# Altium schematic sheet FORMULA.SchDoc: ТО2429
size 410 x 297 mm; ApprovedBy: Стерхов В.Д.; CheckedBy: Стерхов В.Д.; Author: Сергеев Д.А.; CompanyName: ГК "СНАБЖЕНИЕ"; DrawnBy: Сергеев Д.А.; Engineer: Сергеев Д.А.; Organization: ГК "СНАБЖЕНИЕ"; DocumentNumber: ТО2429; Revision: 1; SheetNumber: 2; SheetTotal: 2
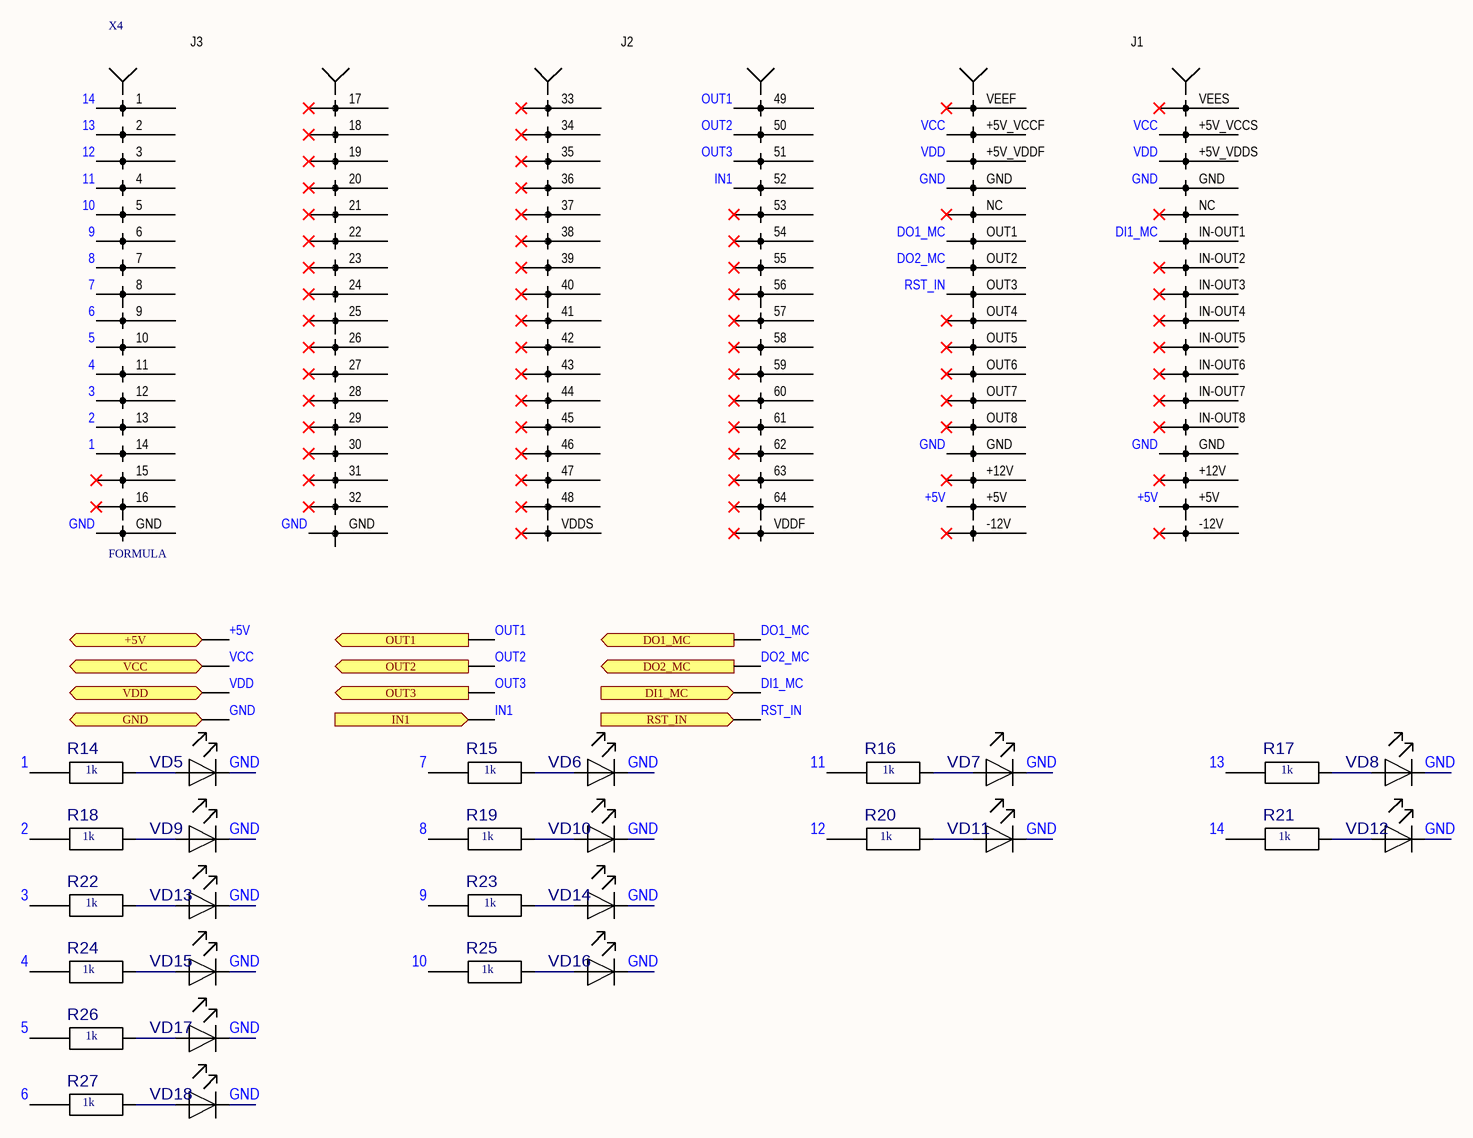
[diagram p0: FORMULA.SchDoc]

## Parts
R14  1k  [0603]
R15  1k  [0603]
R16  1k  [0603]
R17  1k  [0603]
R18  1k  [0603]
R19  1k  [0603]
R20  1k  [0603]
R21  1k  [0603]
R22  1k  [0603]
R23  1k  [0603]
R24  1k  [0603]
R25  1k  [0603]
R26  1k  [0603]
R27  1k  [0603]
VD5  LED(0603)  [0603(LED)]  (value not drawn)
VD6  LED(0603)  [0603(LED)]  (value not drawn)
VD7  LED(0603)  [0603(LED)]  (value not drawn)
VD8  LED(0603)  [0603(LED)]  (value not drawn)
VD9  LED(0603)  [0603(LED)]  (value not drawn)
VD10  LED(0603)  [0603(LED)]  (value not drawn)
VD11  LED(0603)  [0603(LED)]  (value not drawn)
VD12  LED(0603)  [0603(LED)]  (value not drawn)
VD13  LED(0603)  [0603(LED)]  (value not drawn)
VD14  LED(0603)  [0603(LED)]  (value not drawn)
VD15  LED(0603)  [0603(LED)]  (value not drawn)
VD16  LED(0603)  [0603(LED)]  (value not drawn)
VD17  LED(0603)  [0603(LED)]  (value not drawn)
VD18  LED(0603)  [0603(LED)]  (value not drawn)
X4  FORMULA  [FORMULA]

## Ports
+5V (bidir), DI1_MC (in), DO1_MC (out), DO2_MC (out), GND (bidir), IN1 (in), OUT1 (out), OUT2 (out), OUT3 (out), RST_IN (in), VCC (bidir), VDD (bidir)

## Nets
1: R14.1 X4.14
2: R18.1 X4.13
3: R22.1 X4.12
4: R24.1 X4.11
5: R26.1 X4.10
6: R27.1 X4.9
7: R15.1 X4.8
8: R19.1 X4.7
9: R23.1 X4.6
10: R25.1 X4.5
11: R16.1 X4.4
12: R20.1 X4.3
13: R17.1 X4.2
14: R21.1 X4.1
+5V: X4.+5V ; port +5V
DI1_MC: X4.IN-OUT1 ; port DI1_MC
DO1_MC: X4.OUT1 ; port DO1_MC
DO2_MC: X4.OUT2 ; port DO2_MC
GND: VD5.2(K) VD6.2(K) VD7.2(K) VD8.2(K) VD9.2(K) VD10.2(K) VD11.2(K) VD12.2(K) VD13.2(K) VD14.2(K) VD15.2(K) VD16.2(K) VD17.2(K) VD18.2(K) X4.GND ; port GND
IN1: X4.52 ; port IN1
OUT1: X4.49 ; port OUT1
OUT2: X4.50 ; port OUT2
OUT3: X4.51 ; port OUT3
RST_IN: X4.OUT3 ; port RST_IN
VCC: X4.+5V_VCCF(VCCF) X4.+5V_VCCS(VCCS) ; port VCC
VDD: X4.+5V_VDDF(VDDF) X4.+5V_VDDS(VDDS) ; port VDD
NetR14_2: R14.2 VD5.1(A)
NetR15_2: R15.2 VD6.1(A)
NetR16_2: R16.2 VD7.1(A)
NetR17_2: R17.2 VD8.1(A)
NetR18_2: R18.2 VD9.1(A)
NetR19_2: R19.2 VD10.1(A)
NetR20_2: R20.2 VD11.1(A)
NetR21_2: R21.2 VD12.1(A)
NetR22_2: R22.2 VD13.1(A)
NetR23_2: R23.2 VD14.1(A)
NetR24_2: R24.2 VD15.1(A)
NetR25_2: R25.2 VD16.1(A)
NetR26_2: R26.2 VD17.1(A)
NetR27_2: R27.2 VD18.1(A)

Not connected (* = marked no-connect by the designer): X4 15* 16* 17* 18* 19* 20* 21* 22* 23* 24* 25* 26* 27* 28* 29* 30* 31* 32* 33* 34* 35* 36(4)* 37(5)* 38* 39* 40* 41* 42* 43* 44* 45* 46* 47* 48* 53* 54* 55* 56* 57* 58* 59* 60* 61* 62* 63* 64* +12V* -12V* IN-OUT2* IN-OUT3* IN-OUT4* IN-OUT5* IN-OUT6* IN-OUT7* IN-OUT8* NC* OUT4* OUT5* OUT6* OUT7* OUT8* VDDF* VDDS* VEEF* VEES*

## Notes on the sheet
- Перв. примен.
- Справ. №
- Подп. и дата
- Инв. № дубл.
- Взам. инв. №
- Разраб.
- Изм.
- Лист
- № докум.
- Подп.
- Дата
- Литера
- Масса
- Масштаб
- Пров.
- Т.контр.
- Листов
- Инв. № подл.
- Н.контр.
- Утв.
- Форма 1 ГОСТ 2.104-2006
- Копировал
- Формат А3
- (in symbol FORMULA) J3; J2; J1

## Library data of the parts
R14-R27 = R0603 Yageo: ComponentHeigt: 0.5; Firme: Yageo; Leadform: SMD; Kind: Резистор; ClassName: *; Component Link: *; Packaging: 0402; NN: *
VD5-VD18 = LED(0603): ComponentHeigt: 0.75; Leadform: в отверстия; Firme: Kingbright; NN: 24003000; KIND: Светодиод L-1154GD Kingbright; Component Link: *; ClassName: *